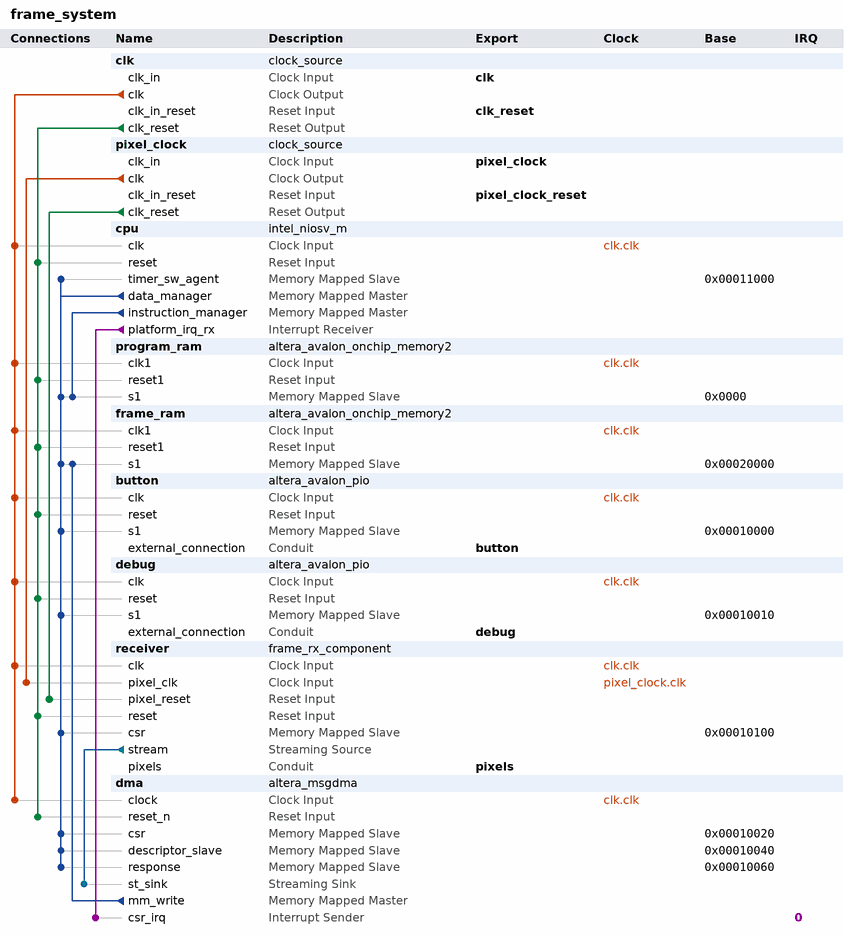
[diagram p0: system contents]
# Platform Designer (Qsys) system frame_system, Cyclone V 5CEFA4F23C6
# Parameters at their usual value, and those the tool derives, are not listed.
package require -exact qsys 25.1
create_system frame_system
set_project_property DEVICE_FAMILY {Cyclone V}
set_project_property DEVICE 5CEFA4F23C6

add_instance clk clock_source 25.1
set_instance_parameter_value clk clockFrequency 50000000
set_instance_parameter_value clk resetSynchronousEdges DEASSERT

add_instance pixel_clock clock_source 25.1
set_instance_parameter_value pixel_clock clockFrequency 25000000
set_instance_parameter_value pixel_clock resetSynchronousEdges DEASSERT

add_instance cpu intel_niosv_m 26.0.0
set_instance_parameter_value cpu enableAvalonInterface true
set_instance_parameter_value cpu enableDebug false
set_instance_parameter_value cpu enableDebugReset false
set_instance_parameter_value cpu enableECCFull false
set_instance_parameter_value cpu enableECCLite false
set_instance_parameter_value cpu hartId 0
set_instance_parameter_value cpu interruptMode 0
set_instance_parameter_value cpu pipelineArch true
set_instance_parameter_value cpu resetSlave program_ram.s1

add_instance program_ram altera_avalon_onchip_memory2 25.1
set_instance_parameter_value program_ram dataWidth 32
set_instance_parameter_value program_ram dualPort false
set_instance_parameter_value program_ram initMemContent true
set_instance_parameter_value program_ram initializationFileName firmware.hex
set_instance_parameter_value program_ram memorySize 32768
set_instance_parameter_value program_ram useNonDefaultInitFile true

add_instance frame_ram altera_avalon_onchip_memory2 25.1
set_instance_parameter_value frame_ram dataWidth 32
set_instance_parameter_value frame_ram dualPort false
set_instance_parameter_value frame_ram initMemContent false
set_instance_parameter_value frame_ram initializationFileName onchip_mem.hex
set_instance_parameter_value frame_ram memorySize 65536

add_instance button altera_avalon_pio 25.1
set_instance_parameter_value button direction Input
set_instance_parameter_value button width 1

add_instance debug altera_avalon_pio 25.1
set_instance_parameter_value debug direction Output
set_instance_parameter_value debug width 32

add_instance receiver frame_rx_component 1.0

add_instance dma altera_msgdma 25.1
set_instance_parameter_value dma BURST_ENABLE 0
set_instance_parameter_value dma DATA_FIFO_DEPTH 128
set_instance_parameter_value dma DATA_WIDTH 32
set_instance_parameter_value dma DESCRIPTOR_FIFO_DEPTH 8
set_instance_parameter_value dma ENHANCED_FEATURES 0
set_instance_parameter_value dma ERROR_ENABLE 0
set_instance_parameter_value dma MAX_BURST_COUNT 2
set_instance_parameter_value dma MAX_BYTE 65536
set_instance_parameter_value dma MODE 2
set_instance_parameter_value dma PACKET_ENABLE 1
set_instance_parameter_value dma RESPONSE_PORT 0
set_instance_parameter_value dma SIDEBAND_ENABLE 0
set_instance_parameter_value dma TRANSFER_TYPE {Aligned Accesses}

# connections
add_connection clk.clk button.clk clock
add_connection clk.clk cpu.clk clock
add_connection clk.clk debug.clk clock
add_connection clk.clk dma.clock clock
add_connection clk.clk frame_ram.clk1 clock
add_connection clk.clk program_ram.clk1 clock
add_connection clk.clk receiver.clk clock
add_connection pixel_clock.clk receiver.pixel_clk clock
add_connection clk.clk_reset button.reset reset
add_connection clk.clk_reset cpu.reset reset
add_connection clk.clk_reset debug.reset reset
add_connection clk.clk_reset dma.reset_n reset
add_connection clk.clk_reset frame_ram.reset1 reset
add_connection clk.clk_reset program_ram.reset1 reset
add_connection clk.clk_reset receiver.reset reset
add_connection pixel_clock.clk_reset receiver.pixel_reset reset
add_connection cpu.data_manager button.s1 avalon
set_connection_parameter_value cpu.data_manager/button.s1 baseAddress 0x00010000
add_connection cpu.data_manager cpu.timer_sw_agent avalon
set_connection_parameter_value cpu.data_manager/cpu.timer_sw_agent baseAddress 0x00011000
add_connection cpu.data_manager debug.s1 avalon
set_connection_parameter_value cpu.data_manager/debug.s1 baseAddress 0x00010010
add_connection cpu.data_manager dma.csr avalon
set_connection_parameter_value cpu.data_manager/dma.csr baseAddress 0x00010020
add_connection cpu.data_manager dma.descriptor_slave avalon
set_connection_parameter_value cpu.data_manager/dma.descriptor_slave baseAddress 0x00010040
add_connection cpu.data_manager dma.response avalon
set_connection_parameter_value cpu.data_manager/dma.response baseAddress 0x00010060
add_connection cpu.data_manager frame_ram.s1 avalon
set_connection_parameter_value cpu.data_manager/frame_ram.s1 baseAddress 0x00020000
add_connection cpu.data_manager program_ram.s1 avalon
set_connection_parameter_value cpu.data_manager/program_ram.s1 baseAddress 0x0000
add_connection cpu.data_manager receiver.csr avalon
set_connection_parameter_value cpu.data_manager/receiver.csr baseAddress 0x00010100
add_connection cpu.instruction_manager program_ram.s1 avalon
set_connection_parameter_value cpu.instruction_manager/program_ram.s1 baseAddress 0x0000
add_connection dma.mm_write frame_ram.s1 avalon
set_connection_parameter_value dma.mm_write/frame_ram.s1 baseAddress 0x00020000
add_connection receiver.stream dma.st_sink avalon_streaming
add_connection cpu.platform_irq_rx dma.csr_irq interrupt
set_connection_parameter_value cpu.platform_irq_rx/dma.csr_irq irqNumber 0

# exported interfaces
add_interface button conduit end
set_interface_property button EXPORT_OF button.external_connection
add_interface clk clock sink
set_interface_property clk EXPORT_OF clk.clk_in
add_interface clk_reset reset sink
set_interface_property clk_reset EXPORT_OF clk.clk_in_reset
add_interface debug conduit end
set_interface_property debug EXPORT_OF debug.external_connection
add_interface pixel_clock clock sink
set_interface_property pixel_clock EXPORT_OF pixel_clock.clk_in
add_interface pixel_clock_reset reset sink
set_interface_property pixel_clock_reset EXPORT_OF pixel_clock.clk_in_reset
add_interface pixels conduit end
set_interface_property pixels EXPORT_OF receiver.pixels

set_interconnect_requirement {$system} qsys_mm.clockCrossingAdapter HANDSHAKE
set_interconnect_requirement {$system} qsys_mm.enableEccProtection FALSE
set_interconnect_requirement {$system} qsys_mm.insertDefaultSlave FALSE
set_interconnect_requirement {$system} qsys_mm.maxAdditionalLatency 1

save_system frame_system.qsys
